# Altium schematic sheet EthIO_08_Display_Key.SchDoc
size A4; SheetNumber: 12; SheetTotal: 12
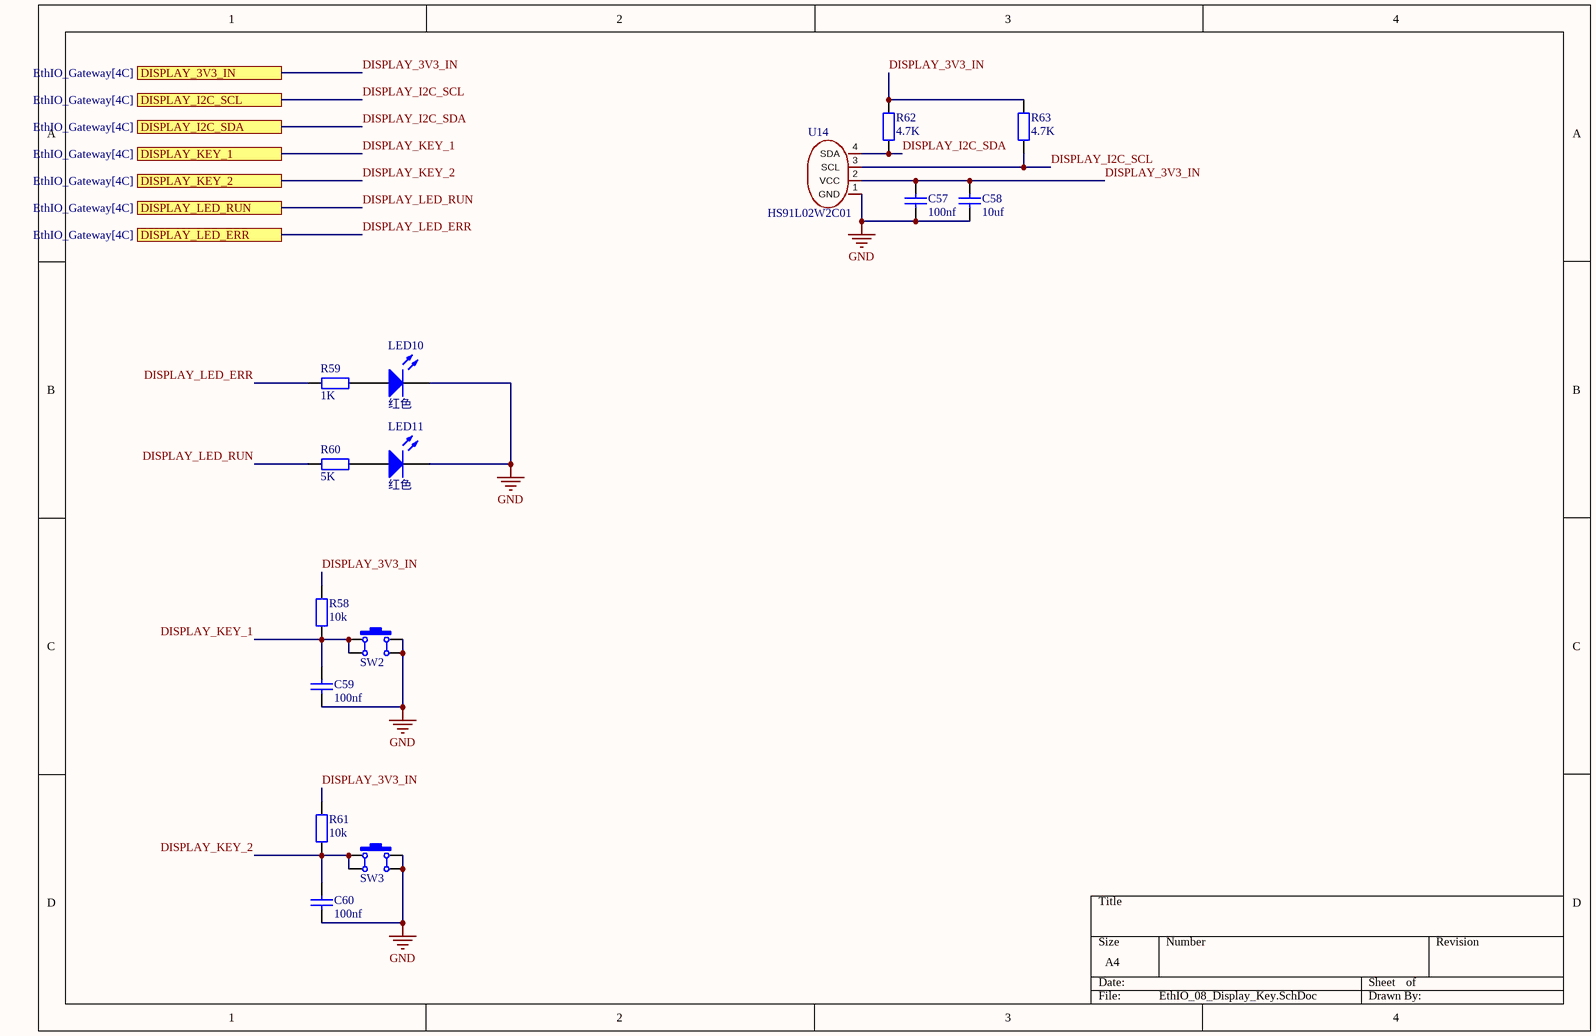
[diagram p0: EthIO_08_Display_Key.SchDoc]

## Parts
C57  100nf  [C0805_L]
C58  10uf  [C0805_L]
C59  100nf  [C0805_L]
C60  100nf  [C0805_L]
LED10  红色  [LED0805_G]
LED11  红色  [LED0805_G]
R58  10k  [R0805_L]
R59  1K  [R0805_L]
R60  5K  [R0805_L]
R61  10k  [R0805_L]
R62  4.7K  [R0805_L]
R63  4.7K  [R0805_L]
SW2  TD-1187SA-250  [SW-SMD-3.5*3.0_4P]  (value not drawn)
SW3  TD-1187SA-250  [SW-SMD-3.5*3.0_4P]  (value not drawn)
U14  HS91L02W2C01  [HS91L02W2C01]

## Ports
DISPLAY_3V3_IN (see EthIO_Gateway[4C]), DISPLAY_I2C_SCL (see EthIO_Gateway[4C]), DISPLAY_I2C_SDA (see EthIO_Gateway[4C]), DISPLAY_KEY_1 (see EthIO_Gateway[4C]), DISPLAY_KEY_2 (see EthIO_Gateway[4C]), DISPLAY_LED_ERR (see EthIO_Gateway[4C]), DISPLAY_LED_RUN (see EthIO_Gateway[4C])

## Nets
GND: C57.1 C58.1 C59.1 C60.1 LED10.2(K) LED11.2(K) SW2.2 SW2.3 SW3.2 SW3.3 U14.1(GND)
DISPLAY_3V3_IN: C57.2 C58.2 R58.1 R61.1 R62.2 R63.2 U14.2(VCC) ; port DISPLAY_3V3_IN
DISPLAY_I2C_SCL: R63.1 U14.3(SCL) ; port DISPLAY_I2C_SCL
DISPLAY_I2C_SDA: R62.1 U14.4(SDA) ; port DISPLAY_I2C_SDA
DISPLAY_KEY_1: C59.2 R58.2 SW2.1 SW2.4 ; port DISPLAY_KEY_1
DISPLAY_KEY_2: C60.2 R61.2 SW3.1 SW3.4 ; port DISPLAY_KEY_2
DISPLAY_LED_ERR: R59.1 ; port DISPLAY_LED_ERR
DISPLAY_LED_RUN: R60.1 ; port DISPLAY_LED_RUN
NetLED10_1: LED10.1(A) R59.2
NetLED11_1: LED11.1(A) R60.2

## Library data of the parts
C57-C60 = C: 贴片电容/MLCC电容; BOM名称: 无极性贴片电容; 当前库版本V2022.12.25 @淘宝卖家:黄晶宝石: 最新版本发布https://shop463601444.taobao.com
LED10 LED11 = LED: 贴片LED; 封装库来自淘宝卖家：黄晶宝石: 其他店铺购入均为盗版封装库，无更新权益，请立即申请退款，本店现金奖励200~1000元; BOM名称: 贴片LED
R58-R63 = R: 贴片电阻; 联系下单店铺卖家 免费帮你查找封装: 联系下单店铺卖家 免费技术支持; BOM名称: 贴片电阻
SW2 SW3 = TD-1187SA-250: 小乌龟-侧按4脚开关 带定位柱; 联系下单店铺卖家 免费技术支持: 联系下单店铺卖家 免费帮你查找封装